# EasyEDA Pro project Orion SR PCB.epro

# Board PCB1
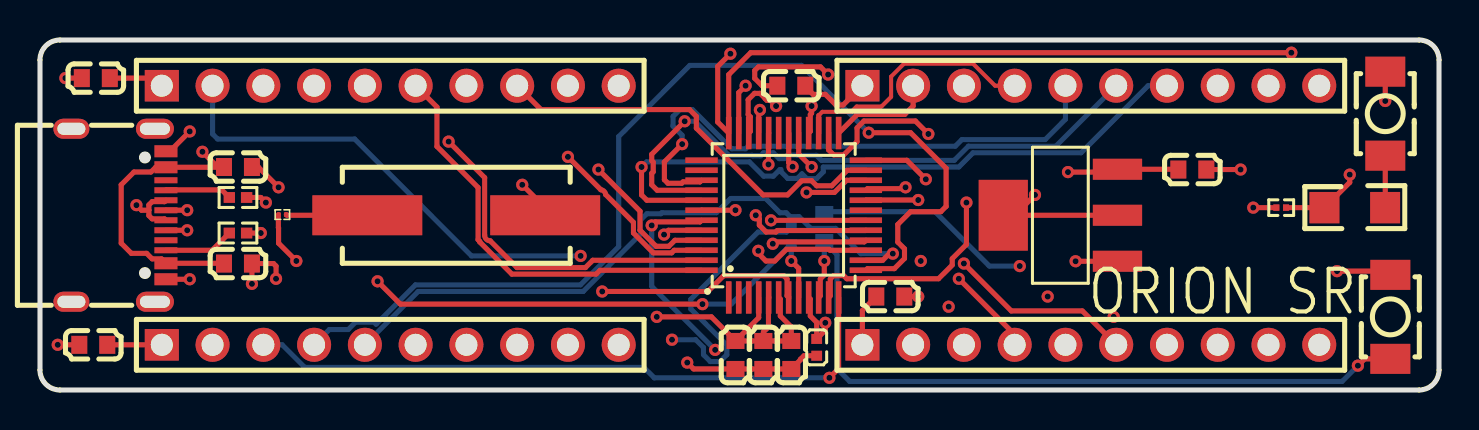
[diagram p0: board, top side]
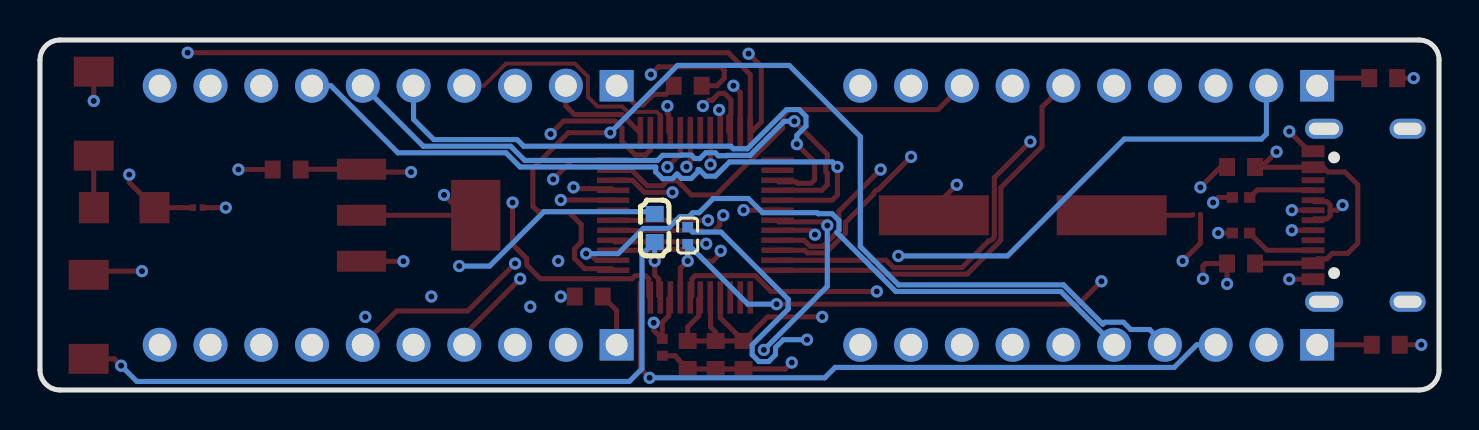
[diagram p1: board, bottom side, seen from below]

Outline 70 x 17.5 mm; copper layers: Top Layer, Inner1, Inner2, Inner3, Inner4, Inner5, Inner6, Bottom Layer. Coordinates in mm from the lower left corner of the outline.
Outline path: 0,16.5 0,1 arc(0.29,0.29) 1,0 69,0 arc(69.71,0.29) 70,1 70,16.5 arc(69.71,17.21) 69,17.5 1,17.5 arc(0.29,17.21) 0,16.5
Stack: Top Layer 0.035mm Outer layer thickness 1oz / Dielectric1 0.1164mm 2116 RC54% 4.9mil / Inner1 0.0152mm Inner layer thickness / Dielectric2 0.3mm 0.3mm H/HOZ No copper / Inner2 0.0152mm Inner layer thickness / Dielectric3 0.0764mm 1080 RC67% 3.3mil / Dielectric4 0.0764mm 1080 RC67% 3.3mil / Inner3 0.0152mm Inner layer thickness / Dielectric5 0.3mm 0.3mm H/HOZ No copper / Inner4 0.0152mm Inner layer thickness / Dielectric6 0.0764mm 1080 RC67% 3.3mil / Dielectric7 0.0764mm 1080 RC67% 3.3mil / Inner5 0.0152mm Inner layer thickness / Dielectric8 0.3mm 0.3mm H/HOZ No copper / Inner6 0.0152mm Inner layer thickness / Dielectric9 0.1164mm 2116 RC54% 4.9mil / Bottom Layer 0.035mm Outer layer thickness 1oz

## Design rules (mm)
spacing copperThickness1oz (default): track to track 0.075, other pairs 0.152 to 0.3
spacing copperThickness2oz: track to track 0.203, other pairs 0.152 to 0.3
track width copperThickness1oz (default): min 0.127, default 0.254, max 2.54
track width copperThickness2oz: min 0.203, default 0.254, max 2.54
differential pair differentialPair (default): width min 0.127, default 0.254, max 2.54; gap min 0.152, default 0.152

## Placement (name value [footprint] x y rotation side)
C1  100nF  [C0603]  42.55 4.67 0 top
C2  100nF  [C0603]  9.91 11.15 0 top
C8  10uF  [C0603]  9.91 6.32 0 top
C9  10uF  [C0603]  57.66 11.02 180 top
C11  100nF  [C0603]  37.59 15.21 180 top
C12  100nF  [C0603]  2.67 2.26 180 top
C13  100nF  [C0603]  34.8 1.75 90 top
C14  100nF  [C0603]  37.59 1.75 270 top
C15  100nF  [C0603]  2.79 15.59 180 top
C16  33pF  [C0402]  38.86 2.13 90 top
C17  33pF  [C0402]  37.59 7.72 90 bottom
C18  100nF  [C0603]  36.2 1.75 90 top
C19  100nF  [C0603]  39.24 8.1 90 bottom
R1  5.1kΩ  [R0402]  9.91 9.63 180 top
R2  5.1kΩ  [R0402]  9.91 7.85 180 top
R3  10kΩ  [R0201]  62.1 9.12 0 top
R5  0Ω  [R01005]  12.13 8.77 0 top
SW1  SW_BUTTON_3x6_SM  [SW-SMD_L3.9-W2.9-LS5.0]  67.31 13.82 90 top
SW2  SW_BUTTON_3x6_SM  [SW-SMD_L3.9-W2.9-LS5.0]  67.56 3.66 90 top
U1  1kΩ  [RES-SMD_L3.5-W1.5]  65.79 9.12 0 top
U3  SSW-110-01-G-S  [HDR-TH_10P-P2.54-V-F-5]  52.58 2.26 0 top
U4  STM32G0B1CET6  [LQFP-48_L7.0-W7.0-P0.50-LS9.0-BL_1]  37.21 8.74 0 top
U5  SSW-110-01-G-S  [HDR-TH_10P-P2.54-V-F-5]  17.53 15.21 0 top
U6  SSW-110-01-G-S  [HDR-TH_10P-P2.54-V-F-5]  52.58 15.21 0 top
U7  SSW-110-01-G-S  [HDR-TH_10P-P2.54-V-F-5]  17.53 2.26 0 top
U8  LD1117S33TR  [SOT-223_L6.5-W3.5-P2.30-LS7.0-BR]  51.05 8.74 0 top
USB1  USB4105-GF-A-060  [USB-C-SMD_GT-USB-7010E-1]  3.94 8.74 270 top
X1  8MHz  [CRYSTAL-SMD_L11.5-W4.8-LS12.7]  20.83 8.74 180 top

## Footprints (pads in the part's own frame, mm; a bottom-side part is the same pattern mirrored in y, then rotated)
C0402
  rect 0.5x0.54 smd: 1(-0.42,0) 2(0.42,0)
C0603
  rect 0.8x0.9 smd: 1(-0.7,0) 2(0.7,0)
CRYSTAL-SMD_L11.5-W4.8-LS12.7
  rect 5.5x2 smd: 1(-4.45,0) 2(4.45,0)
HDR-TH_10P-P2.54-V-F-5
  rect 1.7x1.575 hole 1.1: 1(-11.43,0)
  round 1.7 hole 1.1: 2(-8.89,0) 3(-6.35,0) 4(-3.81,0) 5(-1.27,0) 6(1.27,0) 7(3.81,0) 8(6.35,0) 9(8.89,0) 10(11.43,0)
LQFP-48_L7.0-W7.0-P0.50-LS9.0-BL_1
  rect 0.28x1.62 smd: 1(-2.75,-4.11) 2(-2.25,-4.11) 3(-1.75,-4.11) 4(-1.25,-4.11) 5(-0.75,-4.11) 6(-0.25,-4.11) 7(0.25,-4.11) 8(0.75,-4.11) 9(1.25,-4.11) 10(1.75,-4.11) 11(2.25,-4.11) 12(2.75,-4.11) 25(2.75,4.11) 26(2.25,4.11) 27(1.75,4.11) 28(1.25,4.11) 29(0.75,4.11) 30(0.25,4.11) 31(-0.25,4.11) 32(-0.75,4.11) 33(-1.25,4.11) 34(-1.75,4.11) 35(-2.25,4.11) 36(-2.75,4.11)
  rect 1.62x0.28 smd: 13(4.11,-2.75) 14(4.11,-2.25) 15(4.11,-1.75) 16(4.11,-1.25) 17(4.11,-0.75) 18(4.11,-0.25) 19(4.11,0.25) 20(4.11,0.75) 21(4.11,1.25) 22(4.11,1.75) 23(4.11,2.25) 24(4.11,2.75) 37(-4.11,2.75) 38(-4.11,2.25) 39(-4.11,1.75) 40(-4.11,1.25) 41(-4.11,0.75) 42(-4.11,0.25) 43(-4.11,-0.25) 44(-4.11,-0.75) 45(-4.11,-1.25) 46(-4.11,-1.75) 47(-4.11,-2.25) 48(-4.11,-2.75)
R0201
  rect 0.303x0.324 smd: 1(-0.241,0) 2(0.241,0)
R0402
  rect 0.566x0.54 smd: 1(-0.433,0) 2(0.433,0)
R01005
  rect 0.18x0.216 smd: 1(-0.17,0) 2(0.17,0)
RES-SMD_L3.5-W1.5
  rect 1.501x1.567 smd: 1(-1.516,0) 2(1.516,0)
SOT-223_L6.5-W3.5-P2.30-LS7.0-BR
  rect 2.465x1.05 smd: 1(2.857,-2.3) 2(2.857,0) 3(2.857,2.3)
  rect 2.465x3.54 smd: 4(-2.857,0)
SW-SMD_L3.9-W2.9-LS5.0
  rect 1.5x2 smd: 1(-2.1,0) 2(2.1,0)
USB-C-SMD_GT-USB-7010E-1
  oval 1x1.9 hole 0.6x1.5: 1(-4.325,1.815) 2(4.325,1.815)
  oval 1x1.8 hole 0.6x1.4: 3(4.325,-2.365) 4(-4.325,-2.365)
  rect 0.6x1.15 smd: A1B12(-3.2,2.365) A4B9(-2.4,2.365) B1A12(3.2,2.365) B4A9(2.4,2.365)
  rect 0.3x1.15 smd: A5(-1.25,2.365) A6(-0.25,2.365) A7(0.25,2.365) A8(1.25,2.365) B5(1.75,2.365) B6(0.75,2.365) B7(-0.75,2.365) B8(-1.75,2.365)

## Nets
GND: C1.2 C2.2 C8.2 C9.1 C11.2 C12.2 C13.1 C14.2 C15.2 C16.1 C17.2 C18.1 C19.2 R1.1 R2.1 R3.1 SW2.2 U3.10 U4.7 U5.10 U6.10 U7.10 U8.1 USB1.1 USB1.2 USB1.3 USB1.4 USB1.A1B12 USB1.B1A12
VBUS: C2.1 C8.1 C9.2 U8.3 USB1.A4B9 USB1.B4A9
VCC: C1.1 C11.1 C12.1 C13.2 C14.1 C15.1 C18.2 SW1.2 U3.1 U4.4 U4.5 U4.6 U5.1 U6.1 U7.1 U8.2 U8.4
BOOT0: R3.2 U1.1 U4.36 U6.8
DN: U4.33 USB1.A7 USB1.B7
DP: U4.34 USB1.A6 USB1.B6
NRST: C19.1 SW2.1 U4.10
PA0: U4.11 U7.2
PA1: U4.12 U7.3
PA2: U4.13 U7.4
PA3: U4.14 U7.5
PA4: U4.15 U7.6
PA5: U4.16 U7.7
PA6: U4.17 U7.8
PA7: U4.18 U7.9
PA8: U3.2 U4.28
PA9: U3.3 U4.29
PA10: U3.4 U4.32
PB1: U3.5 U4.20
PB2: U3.6 U4.21
PB3: U3.7 U4.42
PB4: U3.9 U4.43
PB5: U4.44 U5.2
PB6: U4.45 U5.3
PB7: U4.46 U5.4
PB8: U4.47 U5.5
PB9: U4.48 U5.6
PB10: U4.22 U5.7
PB11: U4.23 U5.8
PB12: U4.24 U5.9
PB13: U4.25 U6.2
PB14: U4.26 U6.3
PB15: U4.27 U6.4
PC6: U3.8 U4.30
PD1: U4.39 U6.5
PD2: U4.40 U6.6
PD3: U4.41 U6.7
SWDIO: U4.35 U6.9
XIN: C17.1 U4.8 X1.1
XOUT: R5.2 X1.2
$2N36: R1.2 USB1.A5
$2N38: R2.2 USB1.B5
$2N85: SW1.1 U1.2
$2N236: C16.2 R5.1 U4.9

Pads without a net: U4 1 2 3 19 31 37 38; USB1 A8 B8

## Via types
v1: diameter 0.61, hole 0.305, Top Layer to Bottom Layer, 75 vias

## Routing (per net, layer and track width the routed paths; a pad name or vN(x,y) marks a point on that pad's centre or on a via; arc(x,y) is an arc through that point)
GND: length 83.6
  Top Layer w0.254: C2.2 10.92,11.15 v1(11.94,10.13) ; USB1.B1A12 v1(7.49,5.54) ; v1(10.61,5.31) C8.2 11.68,6.32 11.81,6.2 v1(11.81,5.56) ; C1.2 v1(43.94,4.67) ; USB1.A1B12 6.5,11.94 v1(7.49,12.93) ; C15.2 v1(1.27,15.59) ; U8.1 v1(51.82,6.44) ; R2.1 v1(11.05,7.85) ; R3.1 v1(60.71,9.12) ; v1(32.39,1.37) 32.7,1.05 C13.1 C18.1 C14.2 38.05,1.51 38.05,1.53 38.23,1.71 C16.1 ; v1(11.3,9.37) 11.05,9.63 R1.1 ; C9.1 v1(60.07,11.02) ; C11.2 36.13,15.21 35.76,15.58 35.76,15.98 35.94,16.16 39.05,16.16 v1(39.43,15.77) ; SW2.2 67.38,5.94 v1(64.9,5.94) ; U4.7 37.38,4.71 37.38,5.55 37.22,5.72 34.21,5.72 33.42,4.93 v1(28.13,4.93) ; C12.2 v1(0.89,2.26)
  Inner5 w0.254: v1(11.81,5.56) 11.81,4.8 ; 39.5,15.34 39.43,15.4 v1(39.43,15.77) ; v1(11.3,9.37) 12.07,9.37 ; v1(49.02,6.2) 49.78,6.2 ; v1(7.49,12.93) 7.87,13.31 ; v1(43.94,4.67) 44.07,4.55 44.45,4.55 ; v1(11.94,10.13) 12.45,10.13 ; v1(31.62,2.51) 30.86,2.51 ; v1(60.07,11.02) 61.09,11.02 ; v1(28.13,4.93) 27.88,4.67 27.69,4.67 ; USB1.3 1.78,4.62 1.78,5.43 ; v1(7.49,5.54) 7.9,5.54 8.13,5.31 ; v1(32.39,1.37) 31.62,1.37 ; v1(64.9,5.94) 64.26,5.94 ; v1(10.61,5.31) 10.61,4.8 ; v1(51.82,6.44) 50.93,6.44 ; v1(11.05,7.85) 11.56,7.85 ; USB1.4 1.57,11.66 ; USB1.2 4.32,4.41 ; v1(1.27,15.59) 0.76,15.59 ; v1(60.71,9.12) 59.94,9.12 ; v1(0.89,2.26) 0.51,1.88
  Bottom Layer w0.254: C17.2 37.35,7.9 35.92,7.9 32.56,4.53 32.56,4.05 34.37,2.25 34.37,1.76 34.02,1.42 33.54,1.42 33.2,1.76 33.2,2.12 32.81,2.51 v1(31.62,2.51) ; v1(49.02,6.2) 47.5,6.2 44.78,8.91 39.36,8.91 C19.2
VBUS: length 67.2
  Top Layer w0.254: 56.96,11.02 56.94,11.04 U8.3 53.77,10.9 v1(51.43,10.9) ; C8.1 9.19,6.34 USB1.B4A9 6.08,6.56 5.61,6.56 5.34,6.83 4.57,6.83 4.06,7.34 4.06,10.26 4.7,10.9 5.55,10.9 5.79,11.14 9.19,11.14 C2.1 8.89,11.15 v1(8.13,11.91)
  Inner4 w0.254: v1(51.43,10.9) 46.78,10.9 43.78,7.9 35.06,7.9 33.73,9.23 16.69,9.23 15.03,10.9 12.57,10.9 11.56,11.91 v1(8.13,11.91)
VCC: length 42.8
  Top Layer w0.254: U8.2 48.77,8.74 ; 48.77,8.74 U8.4 ; 48.77,8.74 v1(49.78,9.75) ; U4.4 35.96,3.61 C13.2 ; 6.1,15.21 5.72,15.59 C15.1 ; SW1.2 v1(67.31,14.45) ; C18.2 36.2,2.89 36.45,3.15 36.45,4.61 U4.5 ; C18.2 C13.2 ; C18.2 C14.1 37.59,3.15 37.04,3.7 37.04,4.55 U4.6 ; C13.2 33.59,3.66 v1(30.86,3.66) ; C11.1 38.29,15.17 38.68,14.78 39.29,14.78 39.83,14.25 40.18,14.25 41.15,15.21 ; C1.1 41.15,3.98 41.15,2.26 ; 6.1,2.26 C12.1
  Inner6 w0.254: v1(67.31,14.45) 67.31,13.31 ; 6.1,2.26 6.1,0.74 ; v1(30.86,3.66) 29.97,3.66 ; 41.15,2.26 41.15,0.86 ; 6.1,15.21 6.1,16.74 ; v1(49.78,9.75) 51.05,9.75
BOOT0: length 73.8
  Top Layer w0.254: v1(34.54,16.81) 33.91,16.18 33.91,13.4 U4.36 34.46,15.77 35.56,16.86 v1(62.61,16.86) ; v1(65.53,10.77) 65.53,10.38 U1.1 R3.2
  Inner3 w0.254: v1(34.54,16.81) 57.33,16.81 58.93,15.21 ; v1(65.53,10.77) 65.53,11.15 65.33,11.35 65.33,16.56 65.15,16.74 62.74,16.74 v1(62.61,16.86)
DN: length 51.4
  Top Layer w0.254: USB1.B7 6.23,9.42 5.61,9.42 5.45,9.25 5.45,8.99 ; 5.45,8.99 5.45,8.72 5.61,8.56 6.23,8.56 USB1.A7 ; 5.45,8.99 5.08,8.99 v1(4.83,9.24) ; 35.97,14.06 35.96,14.05 U4.33
  Inner4 w0.254: v1(36.02,14) 32.98,14 32.64,14.35 31.88,14.35 31.53,14 28.29,14 27.55,14.75 27.55,15.68 26.88,16.34 25.95,16.34 25.29,15.68 25.29,14.75 24.54,14 23.01,14 22.46,14.55 22.46,15.68 21.8,16.34 20.87,16.34 20.21,15.68 20.21,14.75 19.46,14 17.93,14 17.39,14.55 17.39,15.68 16.72,16.34 10.71,16.34 10.05,15.68 10.05,14.75 9.14,13.84 4.98,13.84 4.52,13.38 4.52,11.86 3.3,10.64 3.3,10.09 4.15,9.24 v1(4.83,9.24)
DP: length 39.5
  Top Layer w0.254: v1(36.83,14.2) 36.54,14.48 36.37,14.48 36.29,14.56 36.29,14.57 36.03,14.83 35.75,14.83 35.43,14.51 35.43,13.77 35.54,13.66 35.54,12.93 U4.34 ; v1(7.37,8.99) 6.31,8.99 USB1.A6 ; USB1.B6 v1(7.37,7.99)
  Inner1 w0.254: v1(36.83,14.2) 36.83,13.44 33.63,10.23 26.3,10.23 24.57,8.5 8.25,8.5 ; v1(7.37,8.99) 8,8.99 8.25,8.74 8.25,8.5 ; v1(7.37,7.99) 8.01,7.99 8.25,8.23 8.25,8.5
NRST: length 37.9
  Top Layer w0.254: v1(39.24,6.45) 39.24,5.75 39.04,5.55 39.04,4.71 U4.10 ; 67.56,1.56 66.28,1.56 v1(65.94,1.22)
  Bottom Layer w0.254: v1(65.94,1.22) 65.15,0.43 40.51,0.43 39.88,1.06 39.88,6.77 C19.1 v1(39.24,6.45)
PA0: length 58.5
  Top Layer w0.254: U4.11 39.54,4.71 39.54,5.55 39.71,5.72 40.22,5.72 40.37,5.56 44.96,5.56 45.64,6.25 45.64,6.57 46.36,7.28 v1(46.36,9.37)
  Inner3 w0.254: U7.2 10.16,3.78 24.96,3.78 37.61,16.43 39.48,16.43 39.56,16.36 39.88,16.36 40.02,16.22 40.02,14.31 40.18,14.15 41.58,14.15 v1(46.36,9.37)
PA1: length 33.2
  Top Layer w0.254: v1(39.5,0.61) 39.96,1.07 U4.12
  Bottom Layer w0.254: v1(39.5,0.61) 30.73,0.61 30.21,1.13 13.25,1.13 12.12,2.26 U7.3
PA2: length 51.6
  Top Layer w0.254: U4.13 41.4,6.07 42.75,6.07 43.26,6.57 43.26,7.06 42.92,7.4 42.92,8.27 43.56,8.91 45.07,8.91 45.34,9.18 45.34,11.09 43.56,12.86 v1(41.47,12.86)
  Bottom Layer w0.254: v1(41.47,12.86) 38.1,16.23 32.51,16.23 28.96,12.67 28.96,7.17 27.04,5.26 18.79,5.26 16.82,3.29 16.72,3.39 15.79,3.39 15.42,3.02 14.48,3.02 U7.4
PA3: length 32.6
  Top Layer w0.254: U4.14 42.17,6.49 42.5,6.82 v1(42.67,6.82)
  Bottom Layer w0.254: v1(42.67,6.82) 41.07,6.82 39.81,8.08 38.57,8.08 37.98,8.67 37.53,8.67 37.34,8.86 37.02,8.86 36.31,9.57 34.56,9.57 33.84,8.86 31.11,8.86 31.06,8.81 30.36,8.81 30.02,8.47 30.02,7.99 30.13,7.88 27.18,4.93 18.92,4.93 U7.5
PA4: length 31.8
  Top Layer w0.254: v1(35.94,6.96) 35.94,6.83 36.32,6.45 36.77,6.45 37.35,7.03 39.48,7.03 39.53,6.99 U4.15
  Inner1 w0.254: v1(35.94,6.96) 35.95,6.97 36.12,6.97 36.46,6.63 36.95,6.63 37.49,7.17 37.49,8.86 36.95,9.4 36.45,9.4 36.19,9.65 35.43,9.65 35.18,9.9 26.44,9.9 U7.6
PA5: length 25.6
  Top Layer w0.254: U4.16 41.24,7.41 36.76,7.41 v1(36.67,7.31)
  Inner1 w0.254: U7.7 28.65,9.57 35.04,9.57 35.29,9.32 36.06,9.32 36.31,9.07 36.82,9.07 37.16,8.72 37.16,8.24 36.6,7.68 36.6,7.38 v1(36.67,7.31)
PA6: length 20.8
  Top Layer w0.254: v1(35.81,8.74) 35.99,8.56 35.99,8.24 36.33,7.9 36.82,7.9 36.89,7.97 41.31,7.97 U4.17
  Inner1 w0.254: U7.8 27.13,5.51 32.78,5.51 35.81,8.55 v1(35.81,8.74)
PA7: length 17.5
  Top Layer w0.254: U4.18 41.32,8.48 v1(36.58,8.48)
  Inner1 w0.254: U7.9 29.34,5.18 33.27,5.18 v1(36.58,8.48)
PA8: length 18.6
  Top Layer w0.254: v1(38.61,14.2) 38.61,13.84 38.54,13.77 38.54,12.93 U4.28
  Inner1 w0.254: v1(38.61,14.2) 38.61,14.4 38.79,14.58 39.75,14.58 40.18,14.15 41.45,14.15 44.5,11.1 44.63,11.1 44.91,10.82 44.91,10.27 44.7,10.07 44.7,3.28 U3.2
PA9: length 14.5
  Top Layer w0.254: U4.29 37.96,11.8 v1(38.61,11.15)
  Inner1 w0.254: v1(44.07,6.45) 39.37,11.15 v1(38.61,11.15)
  Inner2 w0.254: U3.3 46.23,4.29 v1(44.07,6.45)
PA10: length 18.1
  Top Layer w0.254: v1(36.45,11.28) 36.45,12.83 U4.32 ; U3.4 48.77,2.77 v1(45.97,5.56)
  Inner2 w0.254: v1(36.45,11.28) 36.45,10.9 36.83,10.51 40.83,10.51 45.4,5.94 45.59,5.94 v1(45.97,5.56)
PB1: length 13
  Top Layer w0.254: v1(43.94,9.5) 41.33,9.5 U4.20
  Inner2 w0.254: 51.31,2.26 44.07,9.5 v1(43.94,9.5)
PB2: length 16.4
  Top Layer w0.254: v1(46.23,6.32) 48.6,3.95 52.15,3.95 U3.6 ; U4.21 41.4,10.07 43.24,10.07 v1(43.31,10.13)
  Inner2 w0.254: v1(43.31,10.13) 43.36,10.08 43.36,9.26 46.23,6.39 v1(46.23,6.32)
PB3: length 28
  Top Layer w0.254: U4.42 33.11,8.99 v1(34.8,8.99)
  Inner1 w0.254: v1(50.42,4.67) 45.97,4.67 v1(45.47,4.16)
  Inner2 w0.254: v1(45.47,4.16) 43.43,6.2 39.82,6.2 39.48,5.87 37.35,5.87 37.02,6.2 35.43,6.2 35.25,6.38 35.25,8.54 v1(34.8,8.99) ; U3.7 53.98,4.67 v1(50.42,4.67)
PB4: length 39
  Top Layer w0.254: U4.43 33.02,8.41 30.78,8.41 v1(30.61,8.23)
  Inner1 w0.254: 61.47,2.26 59.94,0.74 40.39,0.74 39.12,2.01 v1(33.78,2.01)
  Bottom Layer w0.254: v1(30.61,8.23) 30.61,5.18 v1(33.78,2.01)
PB5: length 29.9
  Top Layer w0.254: v1(31.23,7.77) 31.44,7.99 U4.44
  Inner4 w0.254: v1(27.05,6.7) 30.16,6.7 v1(31.23,7.77)
  Bottom Layer w0.254: U5.2 8.64,12.8 8.89,12.55 15.75,12.55 21.59,6.7 v1(27.05,6.7)
PB6: length 25.9
  Top Layer w0.254: v1(27.94,11.02) 30.02,8.94 30.02,7.99 30.83,7.18 31.47,7.18 31.77,7.49 U4.45
  Inner4 w0.254: U5.3 15.37,11.02 v1(27.94,11.02)
PB7: length 23.2
  Top Layer w0.254: U4.46 31.73,6.99 31.6,6.86 30.69,6.86 29.69,7.85 29.69,8.38 28.31,9.77 arc(28.23,9.93) 28.06,10.01 v1(26.42,11.66)
  Inner4 w0.254: v1(26.42,11.66) 17.27,11.66 U5.4
PB8: length 22.5
  Top Layer w0.254: U4.47 27.66,6.49 27.29,6.12 23.86,6.12 22.53,7.46 arc(22.33,7.54) 22.25,7.74 22.25,10.62 v1(20.45,12.42)
  Inner4 w0.254: U5.5 19.05,12.42 v1(20.45,12.42)
PB9: length 21
  Top Layer w0.254: U4.48 28.02,5.99 27.83,5.79 23.61,5.79 22,7.4 22,7.43 21.92,7.51 21.92,10.12 19.86,12.18 19.86,14.15 U5.6
PB10: length 22.4
  Top Layer w0.254: v1(38.35,9.88) 39.75,9.88 40.36,10.49 U4.22
  Inner4 w0.254: U5.7 24.31,12.24 27.55,12.24 29.91,9.88 v1(38.35,9.88)
PB11: length 20.8
  Top Layer w0.254: U5.8 25.07,14.02 32.5,14.02 32.84,13.68 32.84,13.09 36.18,9.75 37.4,9.75 38.11,10.46 38.61,10.46 38.86,10.21 39.61,10.21 40.39,10.99 U4.23
PB12: length 28.1
  Top Layer w0.254: v1(44.32,10.54) 43.37,11.49 U4.24
  Inner4 w0.254: v1(44.32,10.54) 45.95,10.54 44.27,12.22 44.21,12.22 43.87,12.56 43.87,12.62 43.04,13.45 41.22,13.45 41.08,13.31 33.21,13.31 32.5,14.02 32.02,14.02 31.3,13.31 26.8,13.31 26.42,13.69 U5.9
PB13: length 5.3
  Top Layer w0.254: U4.25 40.89,13.78 43.27,13.78 43.69,14.2 U6.2
PB14: length 10.5
  Top Layer w0.254: v1(44.45,12.8) 43.8,13.45 41.22,13.45 40.88,13.11 40.88,12.42 40.22,11.76 39.71,11.76 39.46,12 U4.26
  Inner1 w0.254: U6.3 46.23,14.58 v1(44.45,12.8)
PB15: length 12.8
  Top Layer w0.2: 38.96,13.72 39.14,13.91 40.6,13.91 40.86,14.17 42.1,14.17 42.59,14.66 42.59,15.67 43.23,16.32 46.68,16.32 47.79,15.21 U6.4
  Top Layer w0.254: U4.27 38.96,13.72
PC6: length 28.8
  Top Layer w0.254: v1(37.66,11.16) 37.46,11.36 U4.30
  Inner1 w0.254: v1(53.72,3.66) 54.23,4.16 57.02,4.16 58.93,2.26
  Inner2 w0.254: v1(37.66,11.16) 37.79,11.16 38.37,11.73 42.53,11.73 43.15,11.12 44.57,11.12 44.91,10.78 44.91,10.29 44.53,9.91 44.53,9.68 50.55,3.66 v1(53.72,3.66)
PD1: length 28.6
  Top Layer w0.254: U4.39 33.02,10.41 32.18,10.41 32.11,10.34 31.42,10.34 31.24,10.51 31.24,11.4 v1(32.13,12.29)
  Bottom Layer w0.254: 51.31,15.21 51.31,13.53 50.29,12.52 46.12,12.52 45.8,12.19 35.43,12.19 35.31,12.06 34.61,12.06 32.65,14.02 32.02,14.02 31.67,13.68 31.67,13.19 32.13,12.74 v1(32.13,12.29)
PD2: length 30.7
  Top Layer w0.254: U4.40 30.88,9.99 30.61,10.26 30.61,10.83 30.68,10.91 30.68,11.39 30.61,11.47 30.61,11.78 v1(32.26,13.44)
  Bottom Layer w0.254: v1(32.26,13.44) 32.77,13.44 34.47,11.73 35.63,11.73 35.65,11.71 36.06,11.71 36.21,11.86 36.69,11.86 36.98,11.57 37.24,11.57 37.41,11.75 37.9,11.75 37.91,11.73 38.85,11.73 39.1,11.48 45.74,11.48 46.45,12.19 50.82,12.19 U6.6
PD3: length 33.8
  Top Layer w0.254: v1(30.1,11.15) 30.1,9.75 30.36,9.49 U4.41
  Bottom Layer w0.254: U6.7 55.44,15.21 52.09,11.86 46.68,11.86 45.97,11.15 39.19,11.15 39.19,10.91 38.85,10.57 38.37,10.57 38.13,10.81 37.9,10.58 37.41,10.58 37.07,10.92 37.07,11.02 37.02,11.02 36.69,10.69 36.21,10.69 35.5,11.4 30.35,11.4 v1(30.1,11.15)
SWDIO: length 30.5
  Top Layer w0.254: U4.35 34.96,14.87 v1(35.31,15.21)
  Inner1 w0.254: v1(35.31,15.21) 35.31,15.68 36.7,17.07 59.61,17.07 61.47,15.21
XIN: length 36.7
  Top Layer w0.254: v1(16.89,5.43) 18.03,4.29 v1(33.15,4.29) ; v1(37.59,6.45) 37.96,6.08 U4.8 ; X1.1 25.28,9.11 v1(24.13,10.26)
  Inner2 w0.254: v1(16.89,5.43) 21.97,10.51 23.88,10.51 v1(24.13,10.26)
  Bottom Layer w0.254: v1(33.15,4.29) 34.58,4.29 C17.1 v1(37.59,6.45)
XOUT: length 4.1
  Top Layer w0.254: 12.33,8.77 12.36,8.74 X1.2
$2N36: length 3.3
  Top Layer w0.254: R1.2 9.09,10.01 6.32,10.01 USB1.A5
$2N38: length 3.5
  Top Layer w0.254: USB1.B5 8.61,6.99 R2.2
$2N85: length 2.6
  Top Layer w0.254: SW1.1 67.31,9.13 U1.2
$2N236: length 36.6
  Top Layer w0.254: U4.9 38.54,4.55 38.54,3.7 38.86,3.38 C16.2 39.29,2.98 v1(39.29,3.36) ; v1(12.83,6.45) 11.94,7.34 11.94,8.1 11.93,8.11 11.93,8.77
  Inner4 w0.254: v1(39.29,3.36) 39.84,3.91 40.51,3.91 40.69,4.09 40.69,4.34 39.17,5.87 27.06,5.87 26.48,6.45 v1(12.83,6.45)

## Copper pours and planes (outline as drawn; the poured copper is in the pictures)
GND on Inner5: -10.86,25.52 -10.84,25.69 -10.79,25.89 -10.69,26.07 -10.57,26.22 -10.41,26.35 -10.23,26.45 -10.03,26.5 -9.86,26.52 74.18,26.52 74.36,26.5 74.55,26.45 74.73,26.35 74.89,26.22 75.02,26.07 75.11,25.89 75.17,25.69 75.18,25.52 75.18,-8.43 75.17,-8.6 75.11,-8.8 75.02,-8.98 74.89,-9.13 74.73,-9.26 74.55,-9.35 74.36,-9.41 74.18,-9.43 -9.86,-9.43 -10.03,-9.41 -10.23,-9.35 -10.41,-9.26 -10.57,-9.13 -10.69,-8.98 -10.79,-8.8 -10.84,-8.6 -10.86,-8.43
VCC on Inner6: 0.13,16.25 0.14,16.42 0.2,16.62 0.29,16.8 0.42,16.95 0.58,17.08 0.76,17.17 0.95,17.23 1.13,17.25 68.96,17.25 69.14,17.23 69.33,17.17 69.51,17.08 69.67,16.95 69.8,16.8 69.89,16.62 69.95,16.42 69.96,16.25 69.96,0.72 69.95,0.54 69.89,0.35 69.8,0.17 69.67,0.01 69.51,-0.11 69.33,-0.21 69.14,-0.26 68.96,-0.28 1.13,-0.28 0.95,-0.26 0.76,-0.21 0.58,-0.11 0.42,0.01 0.29,0.17 0.2,0.35 0.14,0.54 0.13,0.72

## Text on the board
Top Silkscreen Layer: ORION SR
